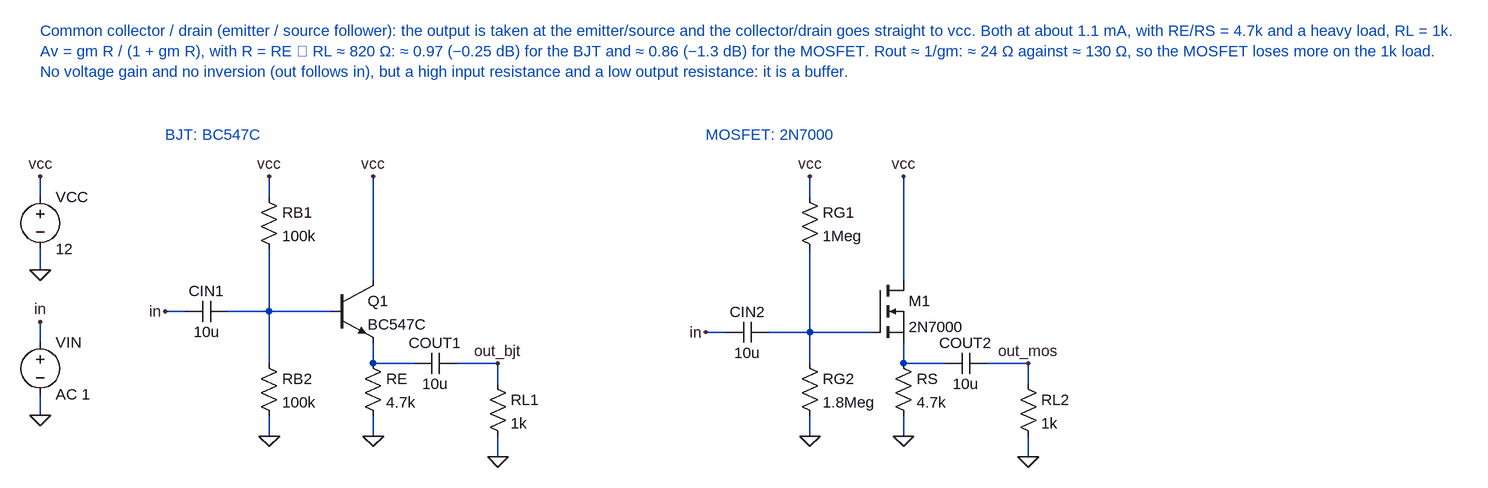
[diagram p0: schematic cc.asc]
cc.asc, the LTspice schematic file:
Version 4
SHEET 1 1600 800
WIRE -448 0 -448 32
WIRE -448 112 -448 144
WIRE -448 224 -448 256
WIRE -448 336 -448 368
WIRE 64 0 64 160
WIRE 64 256 64 288
WIRE 64 368 64 400
WIRE -96 0 -96 32
WIRE -96 112 -96 208
WIRE -96 208 -96 288
WIRE -96 208 0 208
WIRE -96 368 -96 400
WIRE -160 208 -96 208
WIRE -256 208 -224 208
WIRE 64 288 128 288
WIRE 192 288 256 288
WIRE 256 288 256 320
WIRE 256 400 256 432
WIRE 880 0 880 160
WIRE 880 256 880 288
WIRE 880 368 880 400
WIRE 736 0 736 32
WIRE 736 112 736 240
WIRE 736 240 736 288
WIRE 736 240 832 240
WIRE 736 368 736 400
WIRE 672 240 736 240
WIRE 576 240 608 240
WIRE 880 288 944 288
WIRE 1008 288 1072 288
WIRE 1072 288 1072 320
WIRE 1072 400 1072 432
FLAG -448 0 vcc
FLAG -448 144 0
FLAG -448 224 in
FLAG -448 368 0
FLAG 64 0 vcc
FLAG 64 400 0
FLAG -96 0 vcc
FLAG -96 400 0
FLAG -256 208 in
FLAG 256 288 out_bjt
FLAG 256 432 0
FLAG 880 0 vcc
FLAG 880 400 0
FLAG 736 0 vcc
FLAG 736 400 0
FLAG 576 240 in
FLAG 1072 288 out_mos
FLAG 1072 432 0
SYMBOL voltage -448 16 R0
SYMATTR InstName VCC
SYMATTR Value 12
SYMBOL voltage -448 240 R0
SYMATTR InstName VIN
SYMATTR Value AC 1
SYMBOL npn 0 160 R0
SYMATTR InstName Q1
SYMATTR Value BC547C
SYMBOL res 48 272 R0
SYMATTR InstName RE
SYMATTR Value 4.7k
SYMBOL res -112 16 R0
SYMATTR InstName RB1
SYMATTR Value 100k
SYMBOL res -112 272 R0
SYMATTR InstName RB2
SYMATTR Value 100k
SYMBOL cap -160 192 R90
WINDOW 0 0 32 VBottom 2
WINDOW 3 32 32 VTop 2
SYMATTR InstName CIN1
SYMATTR Value 10u
SYMBOL cap 192 272 R90
WINDOW 0 0 32 VBottom 2
WINDOW 3 32 32 VTop 2
SYMATTR InstName COUT1
SYMATTR Value 10u
SYMBOL res 240 304 R0
SYMATTR InstName RL1
SYMATTR Value 1k
SYMBOL nmos 832 160 R0
SYMATTR InstName M1
SYMATTR Value 2N7000
SYMBOL res 864 272 R0
SYMATTR InstName RS
SYMATTR Value 4.7k
SYMBOL res 720 16 R0
SYMATTR InstName RG1
SYMATTR Value 1Meg
SYMBOL res 720 272 R0
SYMATTR InstName RG2
SYMATTR Value 1.8Meg
SYMBOL cap 672 224 R90
WINDOW 0 0 32 VBottom 2
WINDOW 3 32 32 VTop 2
SYMATTR InstName CIN2
SYMATTR Value 10u
SYMBOL cap 1008 272 R90
WINDOW 0 0 32 VBottom 2
WINDOW 3 32 32 VTop 2
SYMATTR InstName COUT2
SYMATTR Value 10u
SYMBOL res 1056 304 R0
SYMATTR InstName RL2
SYMATTR Value 1k
TEXT -448 -224 Left 2 ;Common collector / drain (emitter / source follower): the output is taken at the emitter/source and the collector/drain goes straight to vcc. Both at about 1.1 mA, with RE/RS = 4.7k and a heavy load, RL = 1k.\nAv = gm R / (1 + gm R), with R = RE ∥ RL ≈ 820 Ω: ≈ 0.97 (−0.25 dB) for the BJT and ≈ 0.86 (−1.3 dB) for the MOSFET. Rout ≈ 1/gm: ≈ 24 Ω against ≈ 130 Ω, so the MOSFET loses more on the 1k load.\nNo voltage gain and no inversion (out follows in), but a high input resistance and a low output resistance: it is a buffer.
TEXT -256 -64 Left 2 ;BJT: BC547C
TEXT 576 -64 Left 2 ;MOSFET: 2N7000

The netlist it stands for:
* cc.asc
VCC vcc 0 12
VIN in 0 AC 1
Q1 vcc N002 N001 0 BC547C
RE N001 0 4.7k
RB1 vcc N002 100k
RB2 N002 0 100k
CIN1 N002 in 10u
COUT1 out_bjt N001 10u
RL1 out_bjt 0 1k
M1 vcc N004 N003 N003 2N7000
RS N003 0 4.7k
RG1 vcc N004 1Meg
RG2 N004 0 1.8Meg
CIN2 N004 in 10u
COUT2 out_mos N003 10u
RL2 out_mos 0 1k
.model NPN NPN
.model PNP PNP
.lib standard.bjt
.model NMOS NMOS
.model PMOS PMOS
.lib standard.mos
* Common collector / drain (emitter / source follower): the output is taken at the emitter/source and the collector/drain goes straight to vcc. Both at about 1.1 mA, with RE/RS = 4.7k and a heavy load, RL = 1k.
* Av = gm R / (1 + gm R), with R = RE ∥ RL ≈ 820 Ω: ≈ 0.97 (−0.25 dB) for the BJT and ≈ 0.86 (−1.3 dB) for the MOSFET. Rout ≈ 1/gm: ≈ 24 Ω against ≈ 130 Ω, so the MOSFET loses more on the 1k load.
* No voltage gain and no inversion (out follows in), but a high input resistance and a low output resistance: it is a buffer.
* BJT: BC547C
* MOSFET: 2N7000
.backanno
.end